# Altium project Sensor_Node.PrjPcb
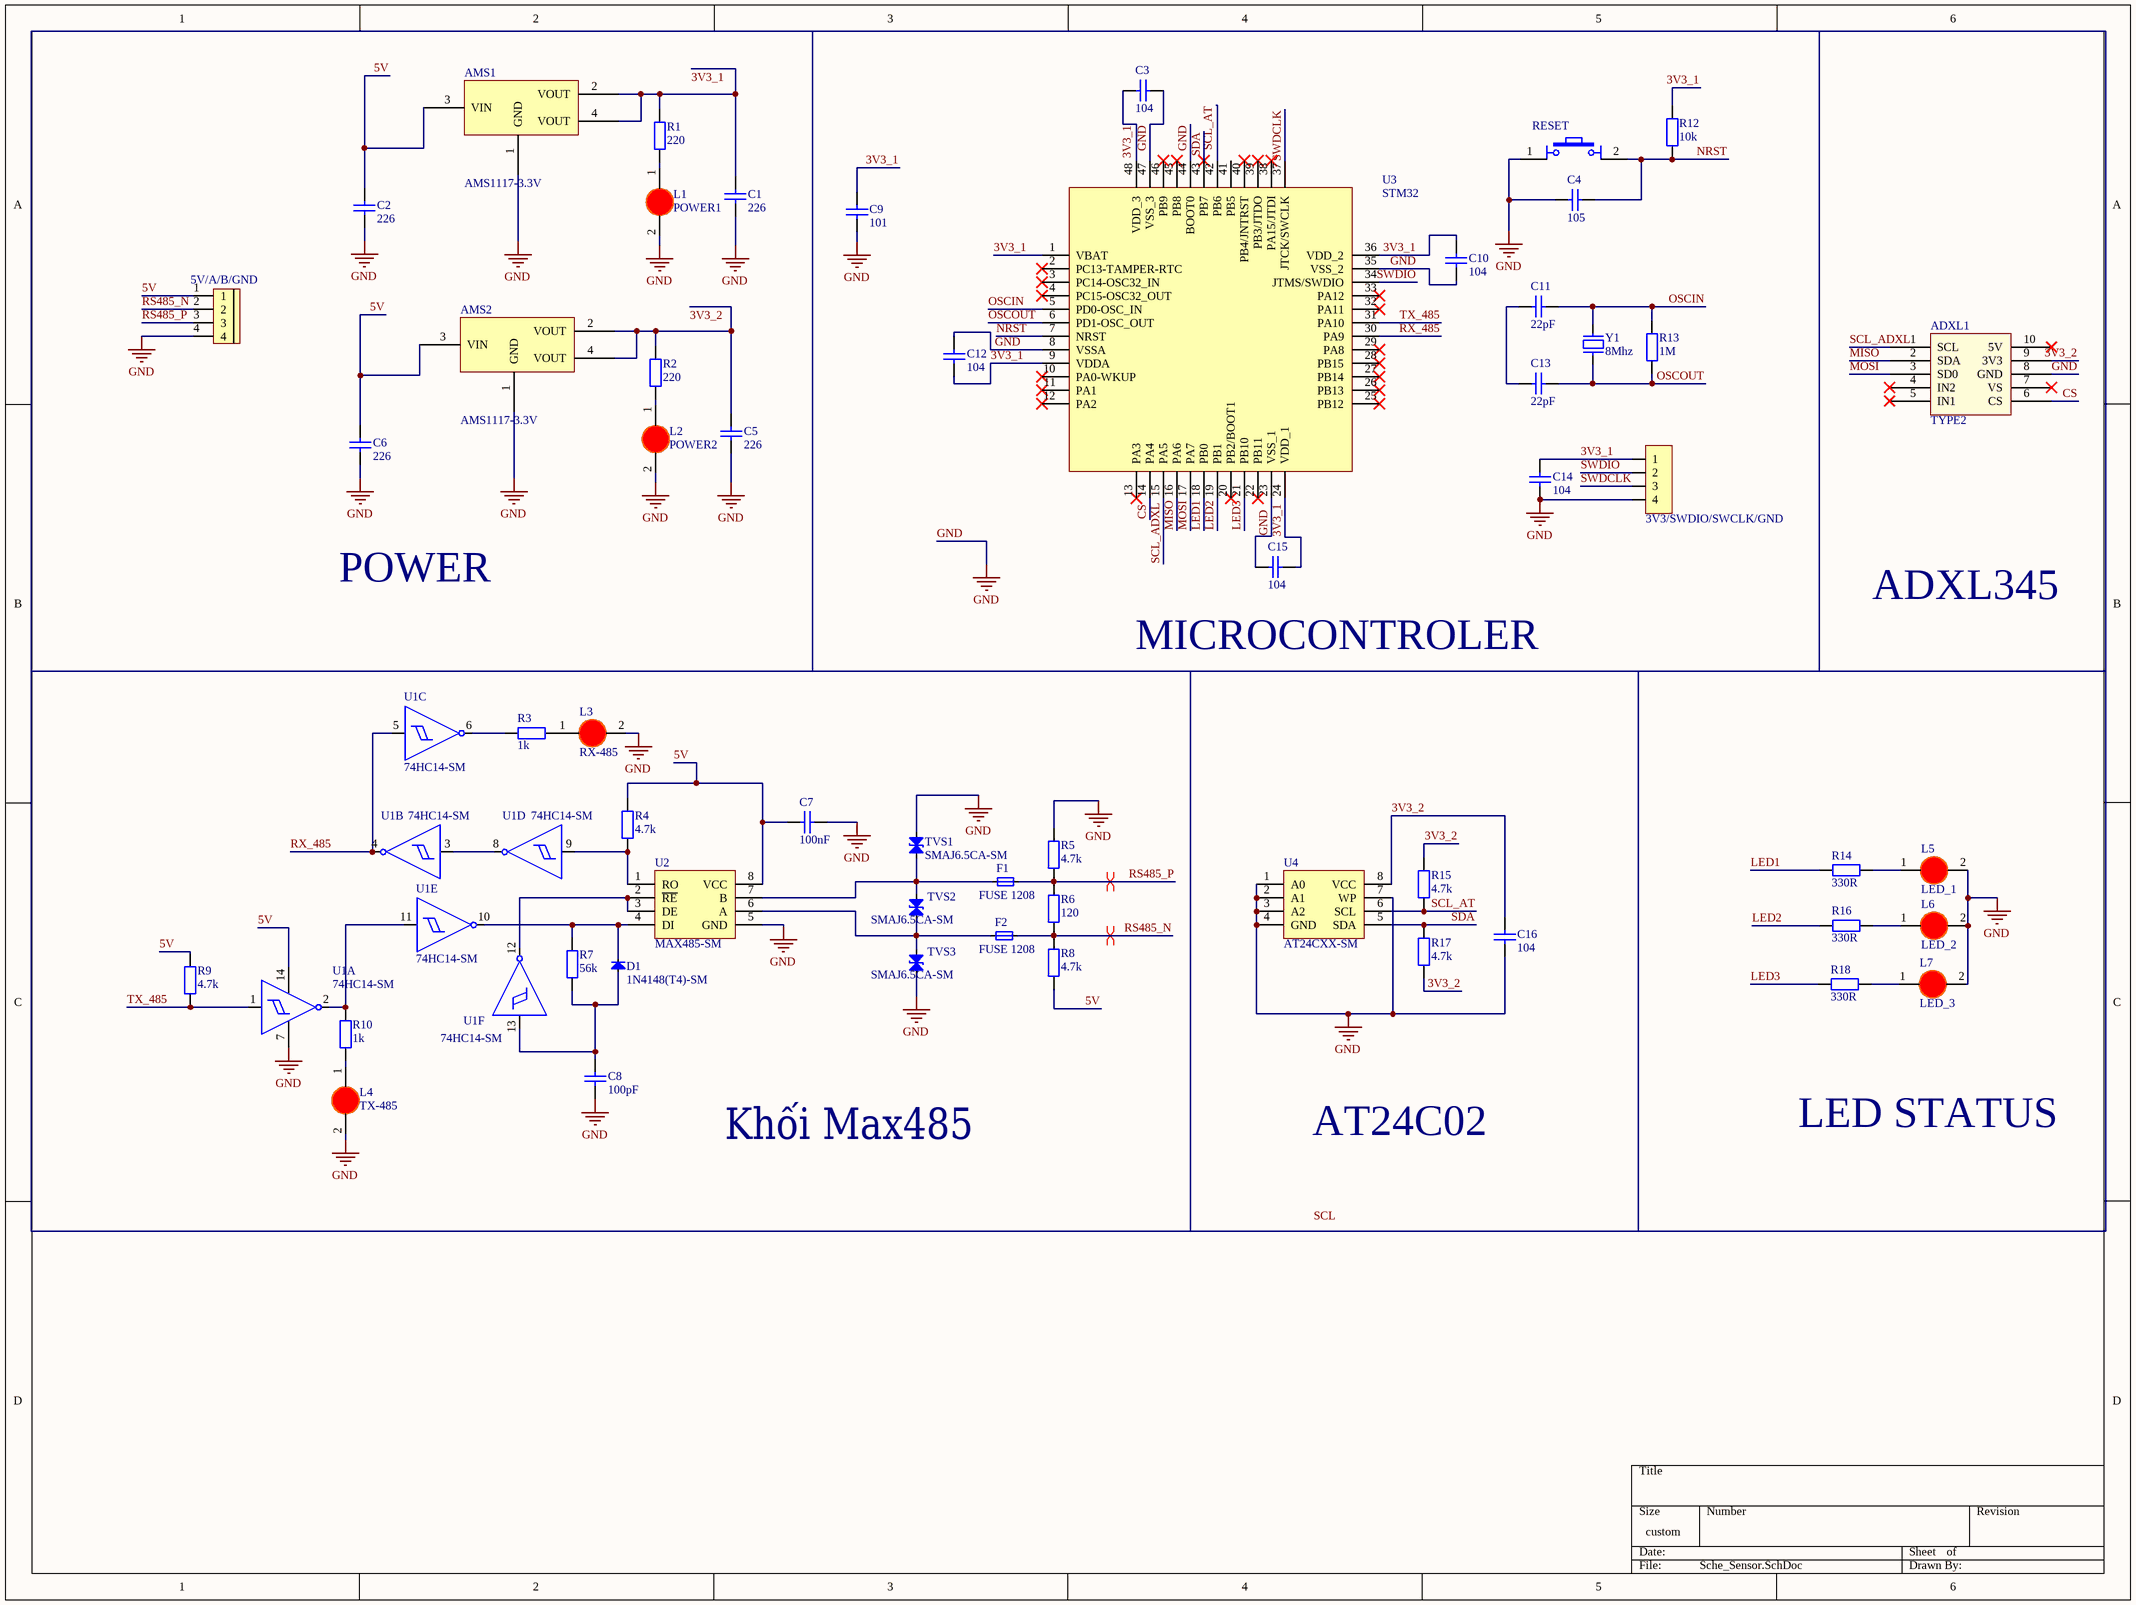
[diagram p0: Sche_Sensor.SchDoc]
1 sheet, 57 parts. Net scope: global (net labels, ports and power ports of the same name join across sheets).
Board file: PCB_Sensor.PcbDoc

## Sheet Sche_Sensor.SchDoc
size 400 x 299 mm; SheetNumber: 1; SheetTotal: 1

### Parts
ADXL1  TYPE2  [ADXL345_TYPE_2]
AMS1  AMS1117-3.3V  [SOT223]
AMS2  AMS1117-3.3V  [SOT223]
BT1  RESET  [Nut Nhan 4 Chan Cam 6x6]
C1  226  [tu 1206]
C2  226  [tu 1206]
C3  104  [tu 1206]
C4  105  [tu 1206]
C5  226  [tu 1206]
C6  226  [tu 1206]
C7  100nF  [tu 1206]
C8  100pF  [tu 1206]
C9  101  [tu 1206]
C10  104  [tu 1206]
C11  22pF  [tu 1206]
C12  104  [tu 1206]
C13  22pF  [tu 1206]
C14  104  [tu 1206]
C15  104  [tu 1206]
C16  104  [tu 1206]
D1  1N4148(T4)-SM  [SOD123G_DO-215AD]
F1  FUSE 1208  [FUSE-CHIP-1812-SM]
F2  FUSE 1208  [FUSE-CHIP-1812-SM]
JP1  3V3/SWDIO/SWCLK/GND  [JP 1x4 DT]
L1  POWER1  [LED-3MM-RED]
L2  POWER2  [LED-3MM-RED]
L3  RX-485  [LED-3MM-RED]
L4  TX-485  [LED-3MM-RED]
L5  LED_1  [LED-3MM-RED]
L6  LED_2  [LED-3MM-RED]
L7  LED_3  [LED-3MM-RED]
P1  5V/A/B/GND  [CON 4 4EDG5.08]
R1  220  [tro smd 0805]
R2  220  [tro smd 0805]
R3  1k  [tro smd 1206]
R4  4.7k  [tro smd 1206]
R5  4.7k  [tro smd 1206]
R6  120  [tro smd 1206]
R7  56k  [tro smd 1206]
R8  4.7k  [tro smd 1206]
R9  4.7k  [tro smd 1206]
R10  1k  [tro smd 1206]
R12  10k  [tro smd 1206]
R13  1M  [tro smd 1206]
R14  330R  [tro smd 1206]
R15  4.7k  [tro smd 1206]
R16  330R  [tro smd 1206]
R17  4.7k  [tro smd 1206]
R18  330R  [tro smd 1206]
TVS1  SMAJ6.5CA-SM  [SMA-J_DO-214AC_TVS-BI]
TVS2  SMAJ6.5CA-SM  [SMA-J_DO-214AC_TVS-BI]
TVS3  SMAJ6.5CA-SM  [SMA-J_DO-214AC_TVS-BI]
U1  74HC14-SM  [SOIC14-1.27-150MIL]  (parts A,B,C,D,E,F of 6)
U2  MAX485-SM  [SOIC8-1.27-150MIL]
U3  STM32  [LQFP48-0.5-7X7MM]
U4  AT24CXX-SM  [SOIC8-1.27-150MIL]
Y1  8Mhz  [Thach Anh 2 chan SMD]

### Nets
GND: ADXL1.8(GND) AMS1.1(GND) AMS2.1(GND) BT1.1 C1.2 C2.2 C3.2 C4.1 C5.2 C6.2 C7.2 C8.2 C9.2 C10.2 C12.1 C14.2 C15.1 C16.2 JP1.4 L1.2(K) L2.2(K) L3.2(K) L4.2(K) L5.2(K) L6.2(K) L7.2(K) P1.4 R5.2 TVS1.2 TVS3.1 U1.7(GND) U2.5(GND) U3.8(VSSA) U3.23(VSS_1) U3.35(VSS_2) U3.44(BOOT0) U3.47(VSS_3) U4.1(A0) U4.2(A1) U4.3(A2) U4.4(GND) U4.7(WP)
3V3_1: AMS1.2(VOUT) AMS1.4(VOUT) C1.1 C3.1 C9.1 C10.1 C12.2 C14.1 C15.2 JP1.1 R1.2 R12.2 U3.1(VBAT) U3.9(VDDA) U3.24(VDD_1) U3.36(VDD_2) U3.48(VDD_3)
3V3_2: ADXL1.9(3V3) AMS2.2(VOUT) AMS2.4(VOUT) C5.1 C16.1 R2.2 R15.1 R17.1 U4.8(VCC)
5V: AMS1.3(VIN) AMS2.3(VIN) C2.1 C6.1 C7.1 P1.1 R4.2 R8.1 R9.1 U1.14(VCC) U2.8(VCC)
CS: ADXL1.6(CS) U3.14(PA4)
LED1: R14.1 U3.18(PB0)
LED2: R16.1 U3.19(PB1)
LED3: R18.1 U3.21(PB10)
MISO: ADXL1.2(SDA) U3.16(PA6)
MOSI: ADXL1.3(SD0) U3.17(PA7)
NRST: BT1.2 C4.2 R12.1 U3.7(NRST)
OSCIN: C11.1 R13.2 U3.5(PD0-OSC_IN) Y1.2
OSCOUT: C13.1 R13.1 U3.6(PD1-OSC_OUT) Y1.1
RS485_N: F2.2 P1.2 R6.2 R8.2
RS485_P: F1.2 P1.3 R5.1 R6.1
RX_485: U1.4(OUT) U1.5(IN) U3.30(PA9)
SCL_ADXL: ADXL1.1(SCL) U3.15(PA5)
SCL_AT: R15.2 U3.42(PB6) U4.6(SCL)
SDA: R17.2 U3.43(PB7) U4.5(SDA)
SWDCLK: JP1.3 U3.37(JTCK/SWCLK)
SWDIO: JP1.2 U3.34(JTMS/SWDIO)
TX_485: R9.2 U1.1(IN) U3.31(PA10)
NetC8_1: C8.1 D1.1 R7.1 U1.13(IN)
NetC11_2: C11.2 C13.2
NetD1_2: D1.2 R7.2 U1.10(OUT) U2.4(DI)
NetF1_1: F1.1 TVS1.1 TVS2.2 U2.7(B)
NetF2_1: F2.1 TVS2.1 TVS3.2 U2.6(A)
NetL1_1: L1.1(A) R1.1
NetL2_1: L2.1(A) R2.1
NetL3_1: L3.1(A) R3.2
NetL4_1: L4.1(A) R10.2
NetL5_1: L5.1(A) R14.2
NetL6_1: L6.1(A) R16.2
NetL7_1: L7.1(A) R18.2
NetR3_1: R3.1 U1.6(OUT)
NetR4_1: R4.1 U1.9(IN) U2.1(RO)
NetR10_1: R10.1 U1.2(OUT) U1.11(IN)
NetU1_3: U1.3(IN) U1.8(OUT)
NetU1_12: U1.12(OUT) U2.2(~{RE}) U2.3(DE)

Not connected (* = marked no-connect by the designer): ADXL1 4(IN2)* 5(IN1)* 7(VS)* 10(5V)*; U3 2(PC13-TAMPER-RTC)* 3(PC14-OSC32_IN)* 4(PC15-OSC32_OUT)* 10(PA0-WKUP)* 11(PA1)* 12(PA2)* 13(PA3)* 20(PB2/BOOT1)* 22(PB11)* 25(PB12)* 26(PB13)* 27(PB14)* 28(PB15)* 29(PA8)* 32(PA11)* 33(PA12)* 38(PA15/JTDI)* 39(PB3/JTDO)* 40(PB4/JNTRST)* 41(PB5) 45(PB8)* 46(PB9)*

### Layout directives
differential pair: RS485_N, RS485_P

### Notes on the sheet
- POWER
- ADXL345
- (near C15) MICROCONTROLER
- Khối Max485
- AT24C02
- LED STATUS
- Labels drawn without touching a wire or pin: SCL

### Library data of the parts
ADXL1 = ADXL345_TYPE_2
AMS1 AMS2 = AMS1117 SMD: Dán; Value: AMS1117-3.3V SOT223; Don_Vi: Con; Ma_Hang: MH000596; Ghi_Chu: *; Kieu_Chan: *; Chung_Loai: Dán
BT1 = Nut Nhan 4 Chan Cam 6x6: Nut Nhan 4 Chan 6x6mm; Ten: Nút Nhấn 4 Chân 6x6x5MM DIP; Ma_Hang: MH004584
C1 C2 C5 C6 = Tu 1206 226 16V 20%: Dán; Don_Vi: Con; So_Chan: 2; Ten_Linh_Kien: Tụ 1206 226-22uF 20% 16V; Ma_Hang: MH004546; Chung_Loai: Dán; Kieu_Chan: *
C3 C9 C10 C12 C14-C16 = Tu 1206 104 50V 20%: Dán; Don_Vi: Con; So_Chan: 2; Ten_Linh_Kien: Tụ 1206 104-0.1uF 20% 50V; Ma_Hang: MH004544; Chung_Loai: Dán; Kieu_Chan: *
C4 = Tu 1206 105 50V 20%: Dán; Don_Vi: Con; So_Chan: 2; Ten_Linh_Kien: Tụ 1206 105-1uF 20% 50V; Ma_Hang: MH004545; Chung_Loai: Dán; Kieu_Chan: *
C7 C8 = Tu 1206 4.7nF 50V: Dán; Don_Vi: Con; So_Chan: 2; Ten_Linh_Kien: Tụ 1206 4.7nF 50V NPO; Ma_Hang: MH007538; Chung_Loai: Dán; Kieu_Chan: *
C11 C13 = Tu 1206 22pF 50V 10%: Dán; Ma_Hang: MH004547; Don_Vi: Con; So_Chan: 2; Ten_Linh_Kien: Tụ 1206 22P 10% 50V; Chung_Loai: Dán; Kieu_Chan: *
D1 = 1N4148(T4)-SM: Fast Switching Diode - Surface Mount
F1 F2 = FUSE-CHIP-SM: Chip Fuses - Surface Mount
JP1 = JP 1x4 2.54 Duc Thang: Cắm; Ten_Linh_Kien: Jump Đơn Đực 2.54MM 1x40P Thẳng 11MM; Don_Vi: Con; Ma_Hang: MH000903; Ghi_Chu: *; Kieu_Chan: *; Chung_Loai: Cắm
L1-L7 = LED 3mm Do: Cắm; Don_Vi: Con; Ma_Hang: MH003892; Ten_Linh_Kien: Led 3MM Phủ Đỏ (10c); Ghi_Chu: *; Kieu_Chan: *; Chung_Loai: Cắm
P1 = CON 4 EDG5.08: Cắm; Ten_Linh_Kien: CON 4 2EDG5.08-4P 5.08MM ( Xanh Cong); Don_Vi: Con; Ma_Hang: MH000979; Ghi_Chu: *; Kieu_Chan: *; Chung_Loai: Cắm
R1 R2 = Tro 0805 5% 2.2k: Dán; Don_Vi: Con; So_Chan: 2; Ten_Linh_Kien: Trở 0805 5% 2.2k; Ma_Hang: MH005237; Chung_Loai: Dán; Kieu_Chan: *
R3 R10 = Tro 1206 1% 1k: Dán; Don_Vi: Con; So_Chan: 2; Ten_Linh_Kien: Trở 1206 1% 1k; Ma_Hang: MH005880; Chung_Loai: Dán; Kieu_Chan: *
R4 R5 R8 R9 R15 R17 = Tro 1206 5% 4.7K: Dán; So_Chan: 2; Don_Vi: Con; Ten_Linh_Kien: Trở 1206 5% 4.7k; Ma_Hang: MH005908; Chung_Loai: Dán; Kieu_Chan: *
R6 = Tro 1206 1% 220k: Dán; Don_Vi: Con; So_Chan: 2; Ten_Linh_Kien: Trở 1206 1% 220K; Ma_Hang: MH005896; Chung_Loai: Dán; Kieu_Chan: *
R7 = Tro 1206 5% 75k: Dán; Don_Vi: Con; So_Chan: 2; Ten_Linh_Kien: Trở 1206 5% 75k; Ma_Hang: MH005920; Chung_Loai: Dán; Kieu_Chan: *
R12 = Tro 1206 5% 10k: Dán; Don_Vi: Con; So_Chan: 2; Ten_Linh_Kien: Trở 1206 5% 10K; Ma_Hang: MH005909; Chung_Loai: Dán; Kieu_Chan: *
R13 = Tro 1206 5% 100K: Dán; Don_Vi: Con; So_Chan: 2; Ten_Linh_Kien: Trở 1206 5% 100k; Ma_Hang: MH005921; Chung_Loai: Dán; Kieu_Chan: *
R14 R16 R18 = Tro 1206 5% 300R: Dán; Don_Vi: Con; So_Chan: 2; Ten_Linh_Kien: Trở 1206 5% 300R; Ma_Hang: MH005926; Chung_Loai: Dán; Kieu_Chan: *
TVS1-TVS3 = SMAJ6.5CA-SM: ESD Suppressors/TVS Diodes 6.5V Bi-Dir - Surface Mount
U1 = 74HC14-SM: Hex Inverting Schmitt Trigger - Surface Mount
U2 = MAX485-SM: Low-Power, Slew-Rate-Limited RS-485/RS-422 Transceivers - Surface Mount
U3 = STM32F103C8T6-1-SM: ARM Microcontrollers - MCU 32BIT Cortex M3 64KB 20KB RAM 2X12 ADC - Surface Mount
U4 = AT24CXX-SM: Two-Wire Serial EEPROM - Surface Mount
Y1 = Thach Anh 2 chan SMD: Crystal For all Crystal 2pin.; Value: 4Mhz